# EasyEDA Pro project climbsnail-spotwelder-45c7d2f7.epro, schematic 大号mos板_8管
Create Date: 2024-03-13; Page Name: P1; Project Name: SpotWelderDev; Schematic Name: 大号mos板_8管; Update Date: 2024-03-13; Company: 嘉立创EDA; Page Size: A4; Version: V1.0
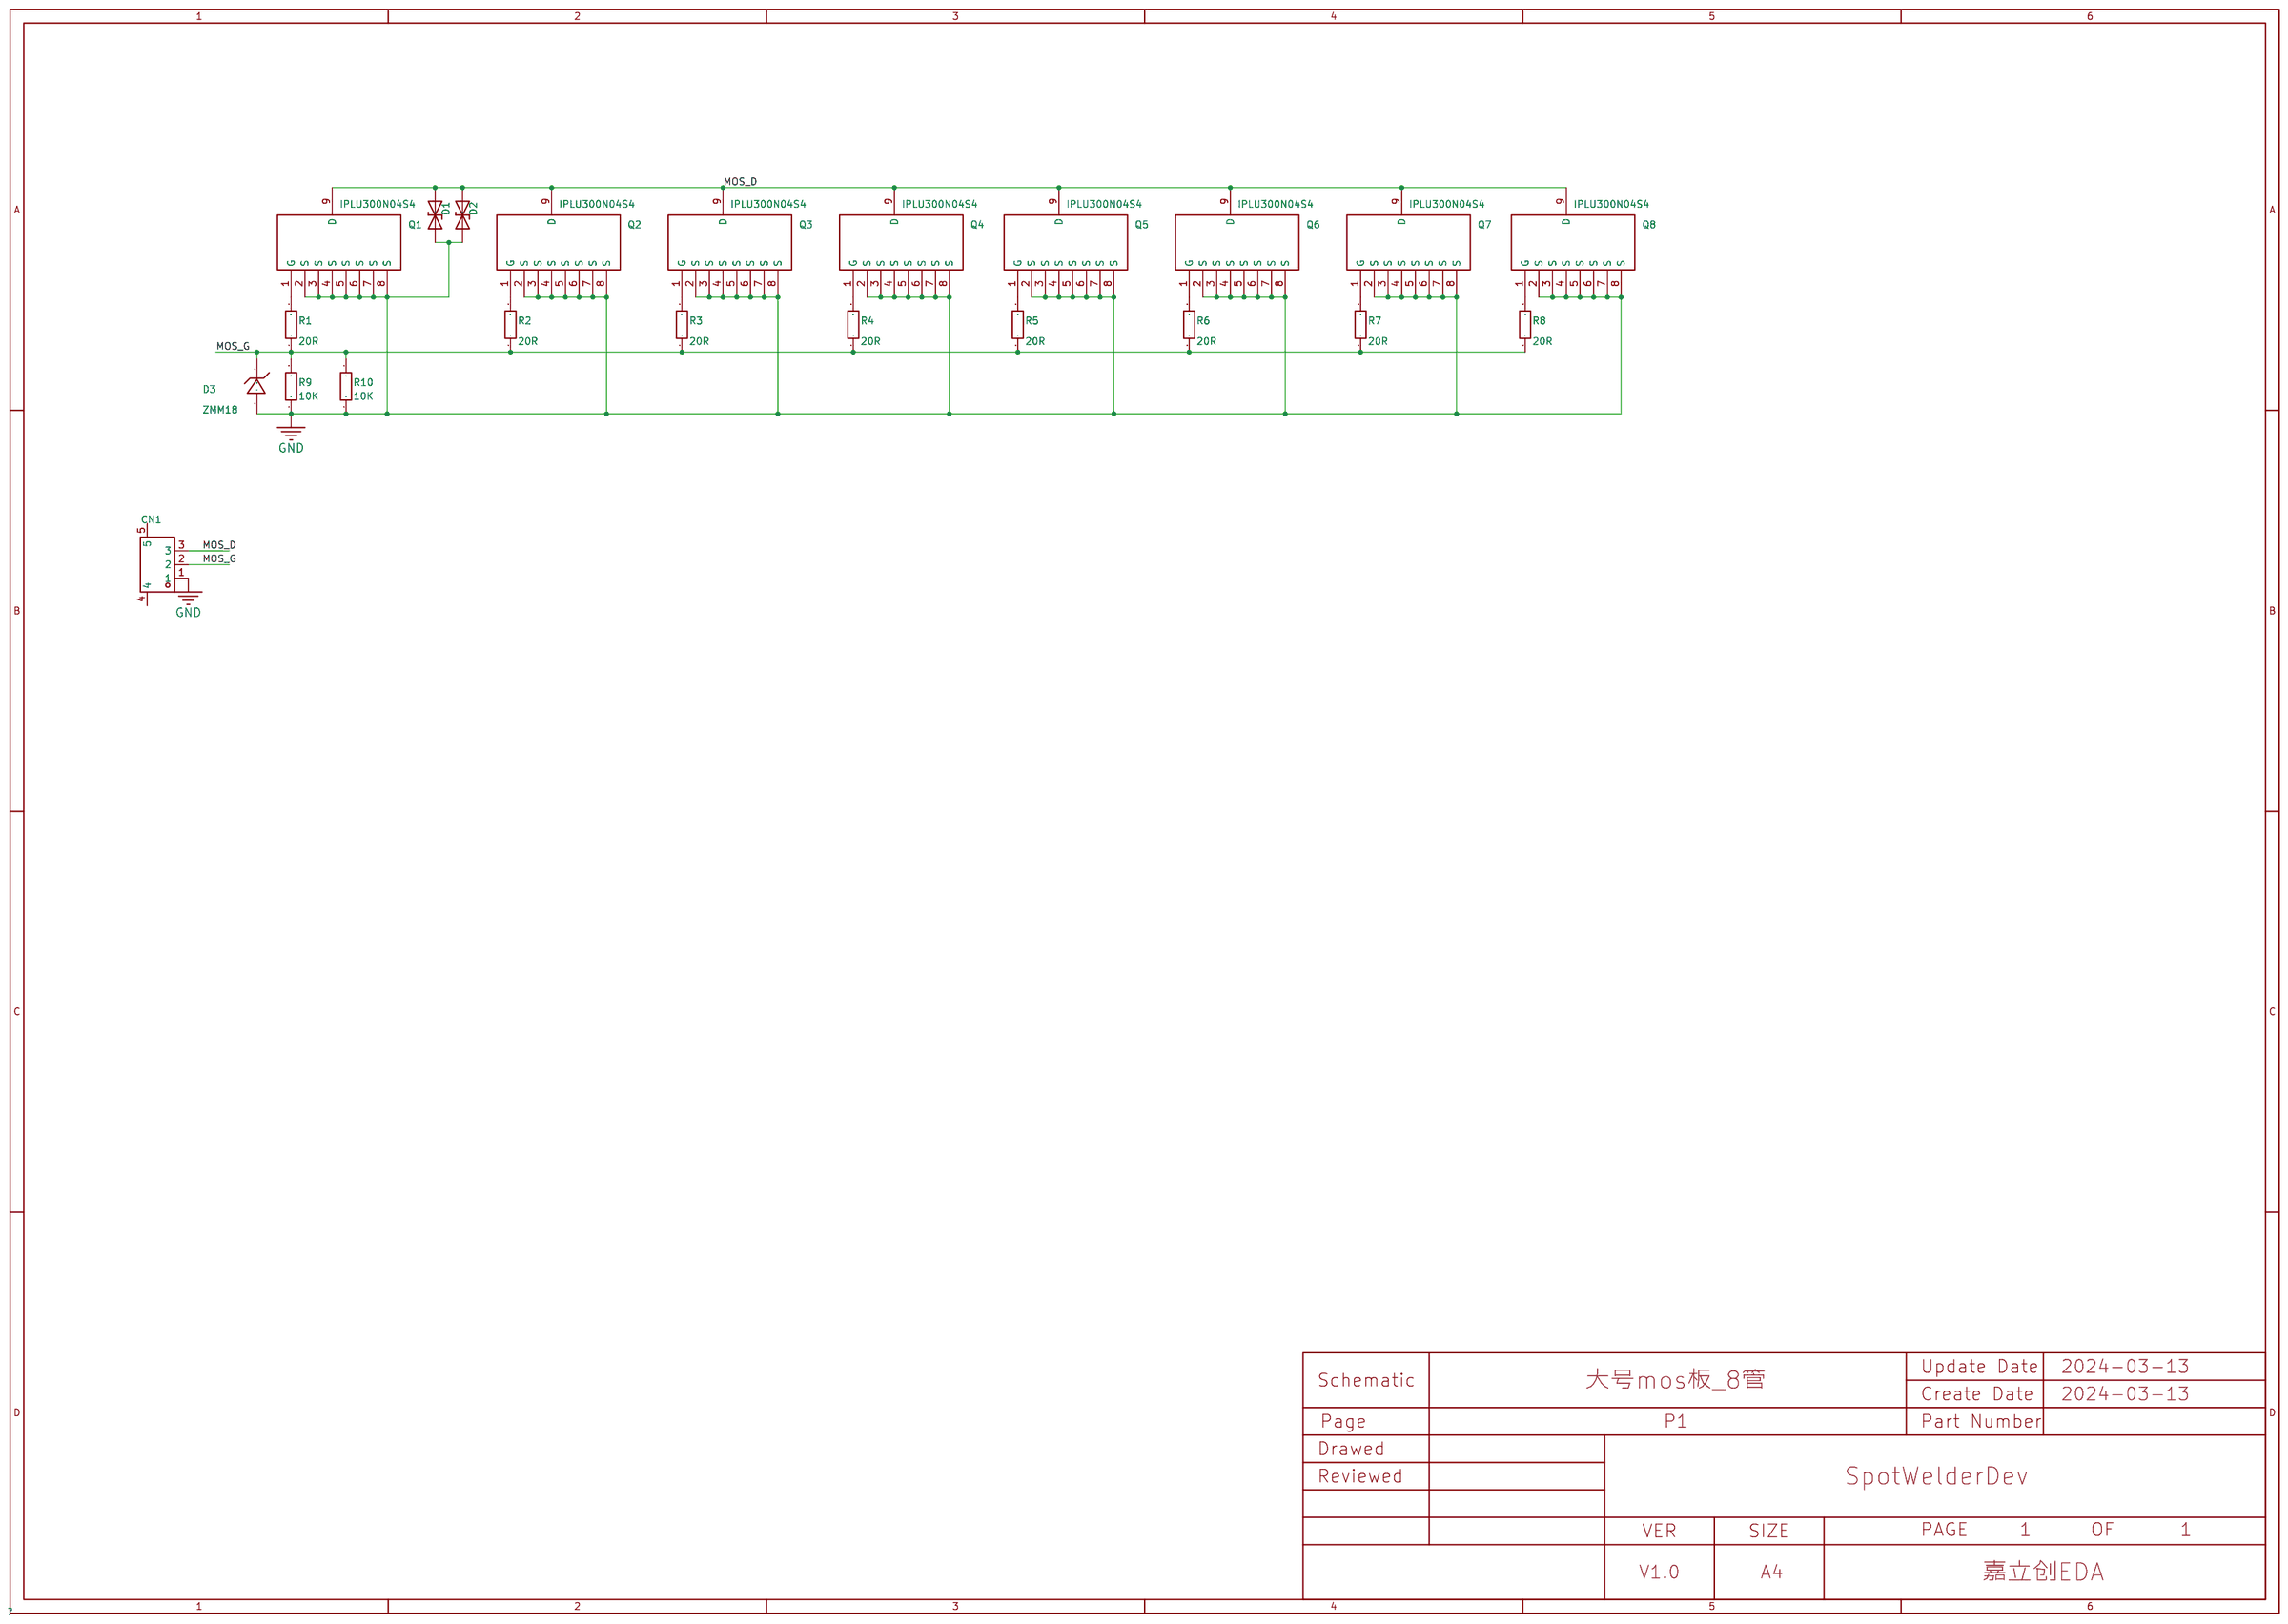
[diagram p2: schematic sheet]

## Parts
CN1  XH2.54-3P  [CONN-SMD_3P-P2.50-WT]
D1  SMBJ28CA双向TVS管  [SMB_L4.6-W3.6-LS5.3-BI]
D2  SMBJ28CA双向TVS管  [SMB_L4.6-W3.6-LS5.3-BI]
D3  ZMM18  [LL-34_L3.5-W1.5-RD]
Q1  IPLU300N04S4  [HSOF-8_L10.0-W10.5-P1.20_1]
Q2  IPLU300N04S4  [HSOF-8_L10.0-W10.5-P1.20_1]
Q3  IPLU300N04S4  [HSOF-8_L10.0-W10.5-P1.20_1]
Q4  IPLU300N04S4  [HSOF-8_L10.0-W10.5-P1.20_1]
Q5  IPLU300N04S4  [HSOF-8_L10.0-W10.5-P1.20_1]
Q6  IPLU300N04S4  [HSOF-8_L10.0-W10.5-P1.20_1]
Q7  IPLU300N04S4  [HSOF-8_L10.0-W10.5-P1.20_1]
Q8  IPLU300N04S4  [HSOF-8_L10.0-W10.5-P1.20_1]
R1  20R  [R0603]
R2  20R  [R0603]
R3  20R  [R0603]
R4  20R  [R0603]
R5  20R  [R0603]
R6  20R  [R0603]
R7  20R  [R0603]
R8  20R  [R0603]
R9  10K  [R0603]
R10  10K  [R0603]

## Library data of the parts
CN1 = XH2.54-3P: Supplier Part: C9900004346; Supplier Footprint: XH2.54-3PSMD; JLCPCB Part Class: 扩展库; Supplier: LCSC
D1 D2 = SMBJ28CA双向TVS管: Pin Type: IN; Supplier: LCSC; Manufacturer Part: SMBJ28CA; Manufacturer: Brightking; Supplier Part: C78417; JLCPCB Part Class: Extended Part
D3 = ZMM18: 二极管配置:独立式;稳压值(标称值):18V;稳压值(范围):16.8V~19.1V;精度:-;功率:500mW;反向电流(Ir):100nA@13V;阻抗(Zzt):50Ω;; LCSC Part Name: 18V 500mW; Supplier Part: C8071; Manufacturer: ST(先科); Supplier Footprint: LL-34; JLCPCB Part Class: Extended Part; Datasheet: https://atta.szlcsc.com/upload/public/pdf/source/20120512/1457706507902.pdf; Supplier: LCSC; Diode Configuration: 独立式; Zener Voltage (Nom): 18V; Zener Voltage (Range): 16.8V~19.1V; Power Dissipation: 500mW; Reverse Leakage Current (Ir): 100nA@13V; Zener Impedance (Zzt): 50Ω
Q1-Q8 = IPLU300N04S4R8XTMA1_1: 类型:N沟道;漏源电压(Vdss):40V;连续漏极电流(Id):300A;功率(Pd):429W;导通电阻(RDS(on)@Vgs,Id):0.77mΩ@10V,100A;阈值电压(Vgs(th)@Id):4V@230A;; LCSC Part Name: N沟道 40V 300A; Supplier Part: C129797; Manufacturer: Infineon(英飞凌); Manufacturer Part: IPLU300N04S4R8XTMA1; Supplier Footprint: H-PSOF-8-1; Datasheet: https://atta.szlcsc.com/upload/public/pdf/source/20170919/C129797_1505787169903976861.pdf; Supplier: LCSC; Type: N沟道; Drain Source Voltage (Vdss): 40V; Continuous Drain Current (Id): 300A; Power Dissipation (Pd): 429W; Drain Source On Resistance (RDS(on)@Vgs,Id): 0.77mΩ@10V,100A; Gate Threshold Voltage (Vgs(th)@Id): 4V@230A; JLCPCB Part Class: Extended Part
R1-R10 = Res_0603: Supplier Footprint: 0603

## Nets
GND: CN1.1 D1.2(A) D2.2(A) D3.2(A) Q1.2(S) Q1.3(S) Q1.4(S) Q1.5(S) Q1.6(S) Q1.7(S) Q1.8(S) Q2.2(S) Q2.3(S) Q2.4(S) Q2.5(S) Q2.6(S) Q2.7(S) Q2.8(S) Q3.2(S) Q3.3(S) Q3.4(S) Q3.5(S) Q3.6(S) Q3.7(S) Q3.8(S) Q4.2(S) Q4.3(S) Q4.4(S) Q4.5(S) Q4.6(S) Q4.7(S) Q4.8(S) Q5.2(S) Q5.3(S) Q5.4(S) Q5.5(S) Q5.6(S) Q5.7(S) Q5.8(S) Q6.2(S) Q6.3(S) Q6.4(S) Q6.5(S) Q6.6(S) Q6.7(S) Q6.8(S) Q7.2(S) Q7.3(S) Q7.4(S) Q7.5(S) Q7.6(S) Q7.7(S) Q7.8(S) Q8.2(S) Q8.3(S) Q8.4(S) Q8.5(S) Q8.6(S) Q8.7(S) Q8.8(S) R9.1 R10.1
MOS_D: CN1.3 D1.1(K) D2.1(K) Q1.9(D) Q2.9(D) Q3.9(D) Q4.9(D) Q5.9(D) Q6.9(D) Q7.9(D) Q8.9(D)
MOS_G: CN1.2 D3.1(C) R1.1 R2.1 R3.1 R4.1 R5.1 R6.1 R7.1 R8.1 R9.2 R10.2
$1N10367: Q1.1(G) R1.2
$1N10753: Q2.1(G) R2.2
$1N10869: Q3.1(G) R3.2
$1N10985: Q4.1(G) R4.2
$1N11101: Q5.1(G) R5.2
$1N11217: Q6.1(G) R6.2
$1N64306: Q7.1(G) R7.2
$1N64637: Q8.1(G) R8.2

Not connected (* = marked no-connect by the designer): CN1 4 5
